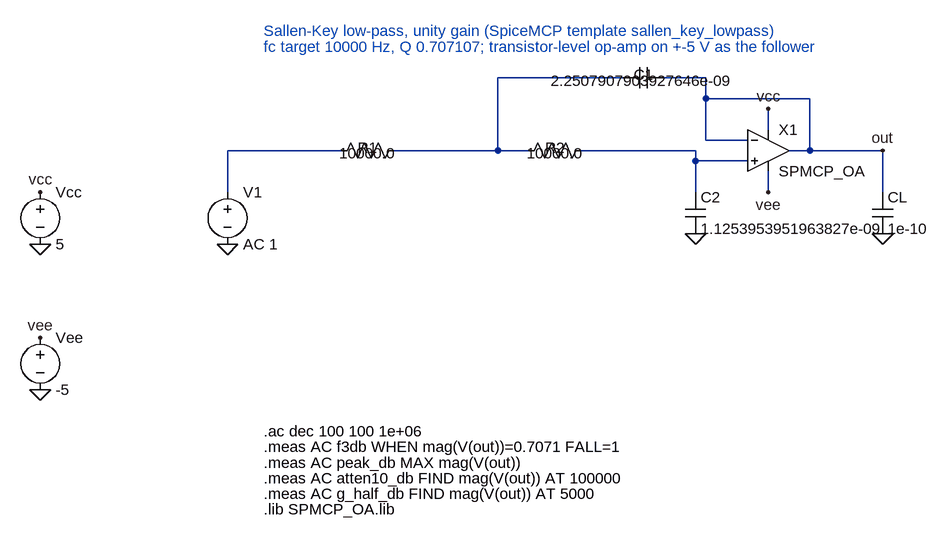
[diagram p0: schematic sallen_key_lowpass.asc]
sallen_key_lowpass.asc, the LTspice schematic file:
Version 4.1
SHEET 1 1600 1200
WIRE 112 0 -64 0
WIRE -64 0 -64 64
WIRE 656 64 656 16
WIRE 656 16 656 0
WIRE 656 0 480 0
WIRE 736 16 656 16
WIRE 400 0 352 0
WIRE 352 0 192 0
WIRE 544 -112 352 -112
WIRE 352 -112 352 0
WIRE 736 -16 672 -16
WIRE 672 -16 672 -80
WIRE 672 -80 672 -112
WIRE 672 -112 608 -112
WIRE 800 0 832 0
WIRE 832 0 832 -80
WIRE 832 -80 672 -80
WIRE 944 64 944 0
WIRE 944 0 832 0
WIRE 768 -32 768 -64
WIRE 768 32 768 64
FLAG 944 0 out
FLAG -352 64 vcc
FLAG -352 288 vee
FLAG 768 -64 vcc
FLAG 768 64 vee
FLAG -64 144 0
FLAG -352 144 0
FLAG -352 368 0
FLAG 656 128 0
FLAG 944 128 0
SYMBOL OpAmps\\opamp2 768 -64 R0
SYMATTR InstName X1
SYMATTR Value SPMCP_OA
SYMBOL cap 544 -96 R270
WINDOW 0 36 32 VBottom 2
WINDOW 3 -4 32 VTop 2
SYMATTR InstName C1
SYMATTR Value 2.2507907903927646e-09
SYMBOL res 96 16 R270
WINDOW 0 36 56 VBottom 2
WINDOW 3 -4 56 VTop 2
SYMATTR InstName R1
SYMATTR Value 10000.0
SYMBOL res 384 16 R270
WINDOW 0 36 56 VBottom 2
WINDOW 3 -4 56 VTop 2
SYMATTR InstName R2
SYMATTR Value 10000.0
SYMBOL cap 640 64 R0
SYMATTR InstName C2
SYMATTR Value 1.1253953951963827e-09
SYMBOL cap 928 64 R0
SYMATTR InstName CL
SYMATTR Value 1e-10
SYMBOL voltage -64 48 R0
SYMATTR InstName V1
SYMATTR Value AC 1
SYMBOL voltage -352 48 R0
SYMATTR InstName Vcc
SYMATTR Value 5
SYMBOL voltage -352 272 R0
SYMATTR InstName Vee
SYMATTR Value -5
TEXT -8 -184 Left 2 ;Sallen-Key low-pass, unity gain (SpiceMCP template sallen_key_lowpass)
TEXT -8 -160 Left 2 ;fc target 10000 Hz, Q 0.707107; transistor-level op-amp on +-5 V as the follower
TEXT -8 432 Left 2 !.ac dec 100 100 1e+06
TEXT -8 456 Left 2 !.meas AC f3db WHEN mag(V(out))=0.7071 FALL=1
TEXT -8 480 Left 2 !.meas AC peak_db MAX mag(V(out))
TEXT -8 504 Left 2 !.meas AC atten10_db FIND mag(V(out)) AT 100000
TEXT -8 528 Left 2 !.meas AC g_half_db FIND mag(V(out)) AT 5000
TEXT -8 552 Left 2 !.lib SPMCP_OA.lib

The netlist it stands for:
* sallen_key_lowpass.asc
X§X1 N002 out vcc vee out SPMCP_OA  ; pins In+ In- V+ V- OUT
C1 N003 out 2.2507907903927646e-09
R1 N001 N003 10000.0
R2 N003 N002 10000.0
C2 N002 0 1.1253953951963827e-09
CL out 0 1e-10
V1 N001 0 AC 1
Vcc vcc 0 5
Vee vee 0 -5
* Sallen-Key low-pass, unity gain (SpiceMCP template sallen_key_lowpass)
* fc target 10000 Hz, Q 0.707107; transistor-level op-amp on +-5 V as the follower
.ac dec 100 100 1e+06
.meas AC f3db WHEN mag(V(out))=0.7071 FALL=1
.meas AC peak_db MAX mag(V(out))
.meas AC atten10_db FIND mag(V(out)) AT 100000
.meas AC g_half_db FIND mag(V(out)) AT 5000
.lib SPMCP_OA.lib
.backanno
.end